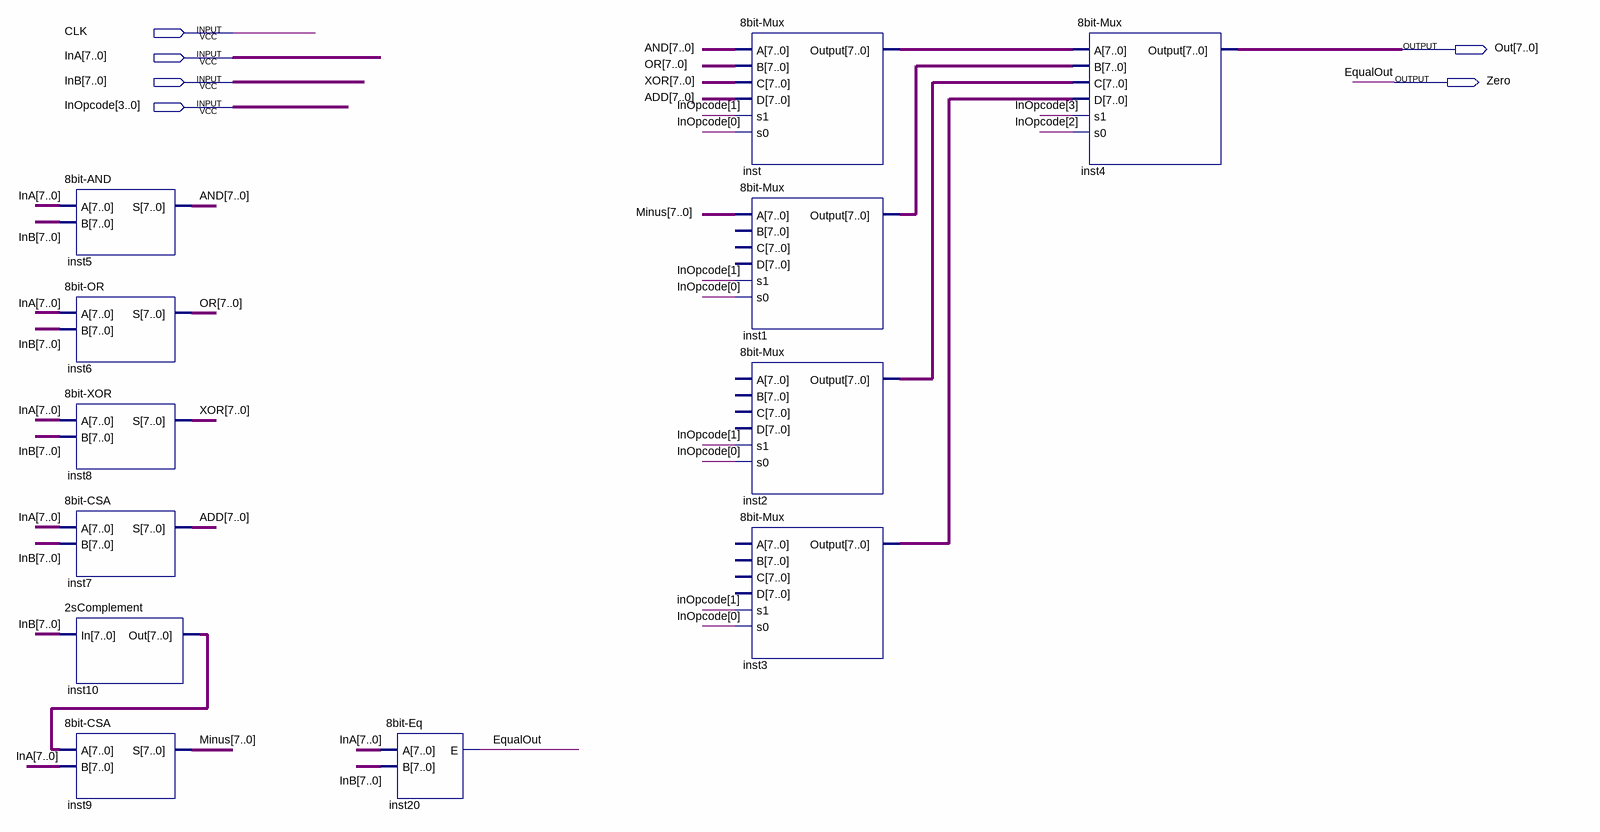
[diagram p0: schematic sheet]
// Quartus schematic ALU.bdf as structural Verilog: 12 symbols, 6 pins
module ALU (
  input  CLK,
  input  [7:0] InA,
  input  [7:0] InB,
  input  [3:0] InOpcode,
  output [7:0] Out,
  output Zero
);

  wire [7:0] ADD, AND, inst1_output, inst2_output, inst3_output, inst10_out, inst_output, Minus, OR, XOR;

  \8bit-AND  inst5 (.A(InA), .B(InB), .S(AND));
  \8bit-OR  inst6 (.A(InA), .B(InB), .S(OR));
  \8bit-XOR  inst8 (.A(InA), .B(InB), .S(XOR));
  \8bit-CSA  inst7 (.A(InA), .B(InB), .S(ADD));
  \2sComplement  inst10 (.In(InB), .Out(inst10_out));
  \8bit-CSA  inst9 (.A(inst10_out), .B(InA), .S(Minus));
  \8bit-Eq  inst20 (.A(InA), .B(InB), .E(Zero));
  \8bit-Mux  inst (.A(AND), .B(OR), .C(XOR), .D(ADD), .s1(InOpcode[1]), .s0(InOpcode[0]), .Output(inst_output));
  \8bit-Mux  inst1 (.A(Minus), .s1(InOpcode[1]), .s0(InOpcode[0]), .Output(inst1_output));  // open: B, C, D
  \8bit-Mux  inst2 (.s1(InOpcode[1]), .s0(InOpcode[0]), .Output(inst2_output));  // open: A, B, C, D
  \8bit-Mux  inst3 (.s1(InOpcode[1]), .s0(InOpcode[0]), .Output(inst3_output));  // open: A, B, C, D
  \8bit-Mux  inst4 (
    .A(inst_output), .B(inst1_output), .C(inst2_output), .D(inst3_output), .s1(InOpcode[3]),
    .s0(InOpcode[2]), .Output(Out));

  // Other names for the same wires on the sheet: EqualOut = Zero
endmodule
